# Altium schematic sheet Sheet4.SchDoc
size A3; SheetNumber: 4; SheetTotal: 6
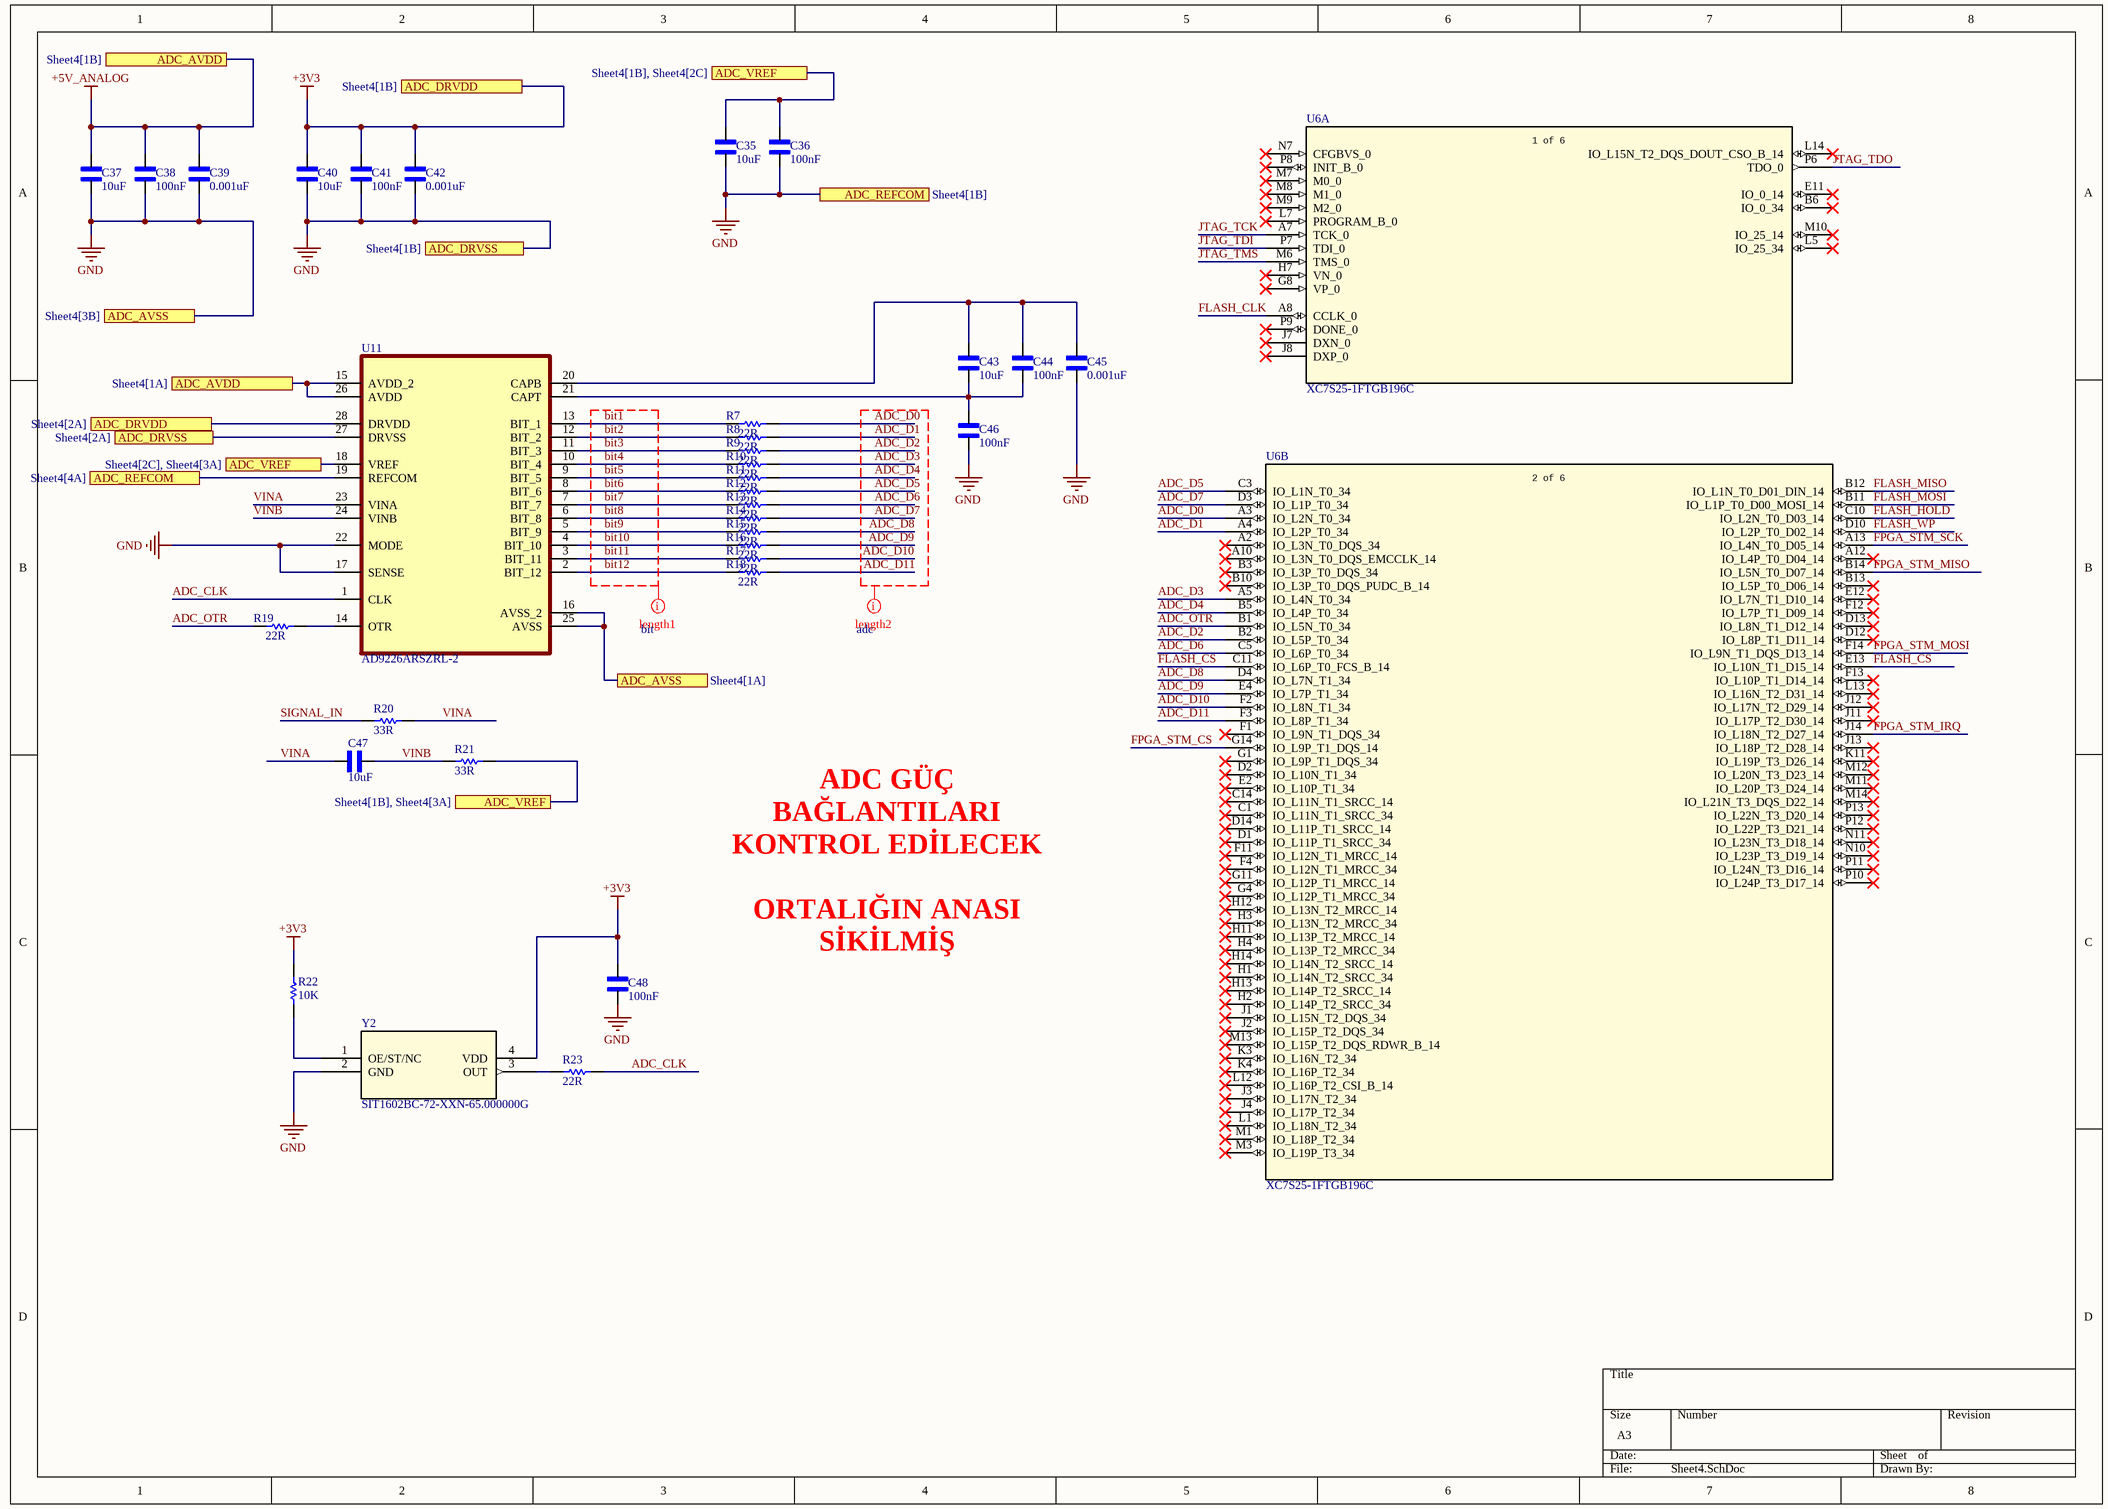
[diagram p0: Sheet4.SchDoc]

## Parts
C35  Parameter 1: 10uF  [0603]  (hidden comment: CAP_CER_0603)
C36  Parameter 1: 100nF  [0603]  (hidden comment: CAP_CER_0603)
C37  Parameter 1: 10uF  [0603]  (hidden comment: CAP_CER_0603)
C38  Parameter 1: 100nF  [0402]  (hidden comment: CC0402JRX7R7BB104)
C39  Parameter 1: 0.001uF  [0402]  (hidden comment: CC0402JRX7R7BB104)
C40  Parameter 1: 10uF  [0603]  (hidden comment: CAP_CER_0603)
C41  Parameter 1: 100nF  [0402]  (hidden comment: CC0402JRX7R7BB104)
C42  Parameter 1: 0.001uF  [0402]  (hidden comment: CC0402JRX7R7BB104)
C43  Parameter 1: 10uF  [0603]  (hidden comment: CAP_CER_0603)
C44  Parameter 1: 100nF  [0402]  (hidden comment: CC0402JRX7R7BB104)
C45  Parameter 1: 0.001uF  [0402]  (hidden comment: CC0402JRX7R7BB104)
C46  Parameter 1: 100nF  [0402]  (hidden comment: CC0402JRX7R7BB104)
C47  Parameter 1: 10uF  [0603]  (hidden comment: CAP_CER_0603)
C48  Parameter 1: 100nF  [0402]  (hidden comment: CC0402JRX7R7BB104)
R7  22R  [RESC1608X55X25LL10T15]
R8  22R  [RESC1608X55X25LL10T15]
R9  22R  [RESC1608X55X25LL10T15]
R10  22R  [RESC1608X55X25LL10T15]
R11  22R  [RESC1608X55X25LL10T15]
R12  22R  [RESC1608X55X25LL10T15]
R13  22R  [RESC1608X55X25LL10T15]
R14  22R  [RESC1608X55X25LL10T15]
R15  22R  [RESC1608X55X25LL10T15]
R16  22R  [RESC1608X55X25LL10T15]
R17  22R  [RESC1608X55X25LL10T15]
R18  22R  [RESC1608X55X25LL10T15]
R19  22R  [RESC1608X55X25LL10T15]
R20  33R  [RESC1608X55X25LL10T15]
R21  33R  [RESC1608X55X25LL10T15]
R22  10K  [RESC1608X55X25LL10T15]
R23  22R  [RESC1608X55X25LL10T15]
U6  XC7S25-1FTGB196C  [FTGB196SPARTAN-7_AMD]  (parts A,B of 6)
U11  AD9226ARSZRL-2  [SSOP-28]
Y2  SIT1602BC-72-XXN-65.000000G  [SON4_SIT1602-7_SIT]

## Ports
ADC_AVDD (see Sheet4[1A]), ADC_AVDD (see Sheet4[1B]), ADC_AVSS (see Sheet4[1A]), ADC_AVSS (see Sheet4[3B]), ADC_DRVDD (see Sheet4[1B]), ADC_DRVDD (see Sheet4[2A]), ADC_DRVSS (see Sheet4[1B]), ADC_DRVSS (see Sheet4[2A]), ADC_REFCOM (see Sheet4[1B]), ADC_REFCOM (see Sheet4[4A]), ADC_VREF (see Sheet4[1B], Sheet4[2C]), ADC_VREF (see Sheet4[1B], Sheet4[3A]), ADC_VREF (see Sheet4[2C], Sheet4[3A])

## Nets
+3V3: C40.2 C41.2 C42.2 C48.2 R22.1 U11.28(DRVDD) Y2.4(VDD) ; port ADC_DRVDD
+5V_ANALOG: C37.2 C38.2 C39.2 U11.15(AVDD_2) U11.26(AVDD) ; port ADC_AVDD
GND: C35.1 C36.1 C37.1 C38.1 C39.1 C40.1 C41.1 C42.1 C45.1 C46.1 C48.1 U11.16(AVSS_2) U11.17(SENSE) U11.19(REFCOM) U11.22(MODE) U11.25(AVSS) U11.27(DRVSS) Y2.2(GND) ; port ADC_REFCOM, port ADC_DRVSS, port ADC_AVSS
ADC_CLK: R23.1 U11.1(CLK)
ADC_D0: R7.1 U6.A3(IO_L2N_T0_34)
ADC_D1: R8.1 U6.A4(IO_L2P_T0_34)
ADC_D2: R9.1 U6.B2(IO_L5P_T0_34)
ADC_D3: R10.1 U6.A5(IO_L4N_T0_34)
ADC_D4: R11.1 U6.B5(IO_L4P_T0_34)
ADC_D5: R12.1 U6.C3(IO_L1N_T0_34)
ADC_D6: R13.1 U6.C5(IO_L6P_T0_34)
ADC_D7: R14.1 U6.D3(IO_L1P_T0_34)
ADC_D8: R15.1 U6.D4(IO_L7N_T1_34)
ADC_D9: R16.1 U6.E4(IO_L7P_T1_34)
ADC_D10: R17.1 U6.F2(IO_L8N_T1_34)
ADC_D11: R18.1 U6.F3(IO_L8P_T1_34)
ADC_OTR: R19.2 U6.B1(IO_L5N_T0_34)
ADC_VREF: C35.2 C36.2 R21.1 U11.18(VREF) ; port ADC_VREF
bit1: R7.2 U11.13(BIT_1)
bit2: R8.2 U11.12(BIT_2)
bit3: R9.2 U11.11(BIT_3)
bit4: R10.2 U11.10(BIT_4)
bit5: R11.2 U11.9(BIT_5)
bit6: R12.2 U11.8(BIT_6)
bit7: R13.2 U11.7(BIT_7)
bit8: R14.2 U11.6(BIT_8)
bit9: R15.2 U11.5(BIT_9)
bit10: R16.2 U11.4(BIT_10)
bit11: R17.2 U11.3(BIT_11)
bit12: R18.2 U11.2(BIT_12)
FLASH_CLK: U6.A8(CCLK_0)
FLASH_CS: U6.C11(IO_L6P_T0_FCS_B_14) U6.E13(IO_L10N_T1_D15_14)
FLASH_HOLD: U6.C10(IO_L2N_T0_D03_14)
FLASH_MISO: U6.B12(IO_L1N_T0_D01_DIN_14)
FLASH_MOSI: U6.B11(IO_L1P_T0_D00_MOSI_14)
FLASH_WP: U6.D10(IO_L2P_T0_D02_14)
FPGA_STM_CS: U6.G14(IO_L9P_T1_DQS_14)
FPGA_STM_IRQ: U6.J14(IO_L18N_T2_D27_14)
FPGA_STM_MISO: U6.B14(IO_L5N_T0_D07_14)
FPGA_STM_MOSI: U6.F14(IO_L9N_T1_DQS_D13_14)
FPGA_STM_SCK: U6.A13(IO_L4N_T0_D05_14)
JTAG_TCK: U6.A7(TCK_0)
JTAG_TDI: U6.P7(TDI_0)
JTAG_TDO: U6.P6(TDO_0)
JTAG_TMS: U6.M6(TMS_0)
SIGNAL_IN: R20.2
VINA: C47.2 R20.1 U11.23(VINA)
VINB: C47.1 R21.2 U11.24(VINB)
NetC43_1: C43.1 C44.1 C46.2 U11.21(CAPT)
NetC43_2: C43.2 C44.2 C45.2 U11.20(CAPB)
NetR19_1: R19.1 U11.14(OTR)
NetR22_2: R22.2 Y2.1(OE/ST/NC)
NetR23_2: R23.2 Y2.3(OUT)

Not connected (* = marked no-connect by the designer): U6 A2(IO_L3N_T0_DQS_34)* A10(IO_L3N_T0_DQS_EMCCLK_14)* A12(IO_L4P_T0_D04_14)* B3(IO_L3P_T0_DQS_34)* B6(IO_0_34)* B10(IO_L3P_T0_DQS_PUDC_B_14)* B13(IO_L5P_T0_D06_14)* C1(IO_L11N_T1_SRCC_34)* C14(IO_L11N_T1_SRCC_14)* D1(IO_L11P_T1_SRCC_34)* D2(IO_L10N_T1_34)* D12(IO_L8P_T1_D11_14)* D13(IO_L8N_T1_D12_14)* D14(IO_L11P_T1_SRCC_14)* E2(IO_L10P_T1_34)* E11(IO_0_14)* E12(IO_L7N_T1_D10_14)* F1(IO_L9N_T1_DQS_34)* F4(IO_L12N_T1_MRCC_34)* F11(IO_L12N_T1_MRCC_14)* F12(IO_L7P_T1_D09_14)* F13(IO_L10P_T1_D14_14)* G1(IO_L9P_T1_DQS_34)* G4(IO_L12P_T1_MRCC_34)* G8(VP_0)* G11(IO_L12P_T1_MRCC_14)* H1(IO_L14N_T2_SRCC_34)* H2(IO_L14P_T2_SRCC_34)* H3(IO_L13N_T2_MRCC_34)* H4(IO_L13P_T2_MRCC_34)* H7(VN_0)* H11(IO_L13P_T2_MRCC_14)* H12(IO_L13N_T2_MRCC_14)* H13(IO_L14P_T2_SRCC_14)* H14(IO_L14N_T2_SRCC_14)* J1(IO_L15N_T2_DQS_34)* J2(IO_L15P_T2_DQS_34)* J3(IO_L17N_T2_34)* J4(IO_L17P_T2_34)* J7(DXN_0)* J8(DXP_0)* J11(IO_L17P_T2_D30_14)* J12(IO_L17N_T2_D29_14)* J13(IO_L18P_T2_D28_14)* K3(IO_L16N_T2_34)* K4(IO_L16P_T2_34)* K11(IO_L19P_T3_D26_14)* L1(IO_L18N_T2_34)* L5(IO_25_34)* L7(PROGRAM_B_0)* L12(IO_L16P_T2_CSI_B_14)* L13(IO_L16N_T2_D31_14)* L14(IO_L15N_T2_DQS_DOUT_CSO_B_14)* M1(IO_L18P_T2_34)* M3(IO_L19P_T3_34)* M7(M0_0)* M8(M1_0)* M9(M2_0)* M10(IO_25_14)* M11(IO_L20P_T3_D24_14)* M12(IO_L20N_T3_D23_14)* M13(IO_L15P_T2_DQS_RDWR_B_14)* M14(IO_L21N_T3_DQS_D22_14)* N7(CFGBVS_0)* N10(IO_L23P_T3_D19_14)* N11(IO_L23N_T3_D18_14)* P8(INIT_B_0)* P9(DONE_0)* P10(IO_L24P_T3_D17_14)* P11(IO_L24N_T3_D16_14)* P12(IO_L22P_T3_D21_14)* P13(IO_L22N_T3_D20_14)*

## Layout directives
net class bit: bit1, bit2, bit3, bit4, bit5, bit6, bit7, bit8, bit9, bit10, bit11, bit12
net class adc: ADC_D0, ADC_D1, ADC_D2, ADC_D3, ADC_D4, ADC_D5, ADC_D6, ADC_D7, ADC_D8, ADC_D9, ADC_D10, ADC_D11

## Notes on the sheet
- ADC GÜÇ BAĞLANTILARI KONTROL EDİLECEK
  ORTALIĞIN ANASI SİKİLMİŞ
- (in symbol XC7S25-1FTGB196C_1, part A) 1 of 6
- (in symbol XC7S25-1FTGB196C_1, part B) 2 of 6

## Library data of the parts
C38 C39 C41 C42 C44-C46 C48 = CAP_CER_0402: CAP CER 0.1UF 16V X7R 0402
R7-R23 = CMP-2000-06928-1: Chip Resistor, 147 KOhm, +/- 1%, 0.1 W, -55 to 155 degC, 0603 (1608 Metric), RoHS, Tape and Reel; Manufacturer: Yageo; Temperature Coefficient: ±100ppm/°C; Power (Watts): 0.1W,1/10W; PCN Other: RC/AC0603/0805/120622/Jan/2013; Kits: PHH6-KIT-ND-RESKIT100K-1M1/10W5750PCS; EDA / CAD Models: DownloadfromAcceleratedDesigns; Online Catalog: RC0603Series; HTML Datasheet: RCSeries,LSuffixDatasheet.html; Resistance (Ohms): 147k; Catalog Drawings: ThickFilmResistorSide; Other Names: 311-147KHRCT; Product Training Modules: ChipResistor; Series: RC; Height: 0.022"(0.55mm); Number of Terminations: 2; Family: ChipResistor-SurfaceMount; Manufacturer URL: http://www.yageo.com/; Tolerance: ±1%; Operating Temperature: -55°C~155°C; Datasheet Version: Rev. 7, 05/2017; Standard Package: 1; Category: Resistors; Packaging: CutTape(CT); Size / Dimension: 0.063"Lx0.031"W(1.60mmx0.80mm); Datasheet URL: http://www.yageo.com/documents/recent/PYu-RC_Group_51_RoHS_L_7.pdf; Package / Case: 0603(1608Metric); Package Reference: 0603; Supplier Device Package: 0603; Composition: ThickFilm; Features: MoistureResistant; Mounting Technology: SurfaceMount; Package Description: 2-Pin Surface Mount Device, Body 1.6 x 0.8 mm
U6 = XC7S25-1FTGB196C_1: Description; Manufacturer_Name: AMD; Type: Embedded; Copyright: Copyright (C) 2025 Ultra Librarian. All rights reserved.; Manufacturer_Part_Number: XC7S25-1FTGB196C; RefDes: RefDes; Supplier: Arrow Electronics; Supplier Part Number: AD9226ARSZ
U11 = AD9226ARSZRL-2: 12-Bit, 65 MSPS Analog-to-Digital Converter
Y2 = SIT1602BC-72-XXN-65.000000G: Oscillator MEMS 65MHz ±25ppm (Stability) 15pF HCMOS/LVCMOS 55% 2.5V/3.3V 4-Pin QFN SMD T/R; Manufacturer: SiTime; Fall Time: 2ns; Max Supply Voltage: 3.63V; Min Supply Voltage: 2.25V; Output Type: LVCMOS; Supplier: Avnet; Supplier Part Number: SIT1602BC-72-XXN-65.000000G; Manufacturer Part Number: SIT1602BC-72-XXN-65.000000G; RoHS: Compliant; Category: Crystals; Pricing: 250=0,94997, 500=0,93011, 1000=0,91025, 2000=0,89039, 4000=0,87053 (USD); Country of Origin: Malaysia, Taiwan, Thailand; Frequency: 65MHz; Frequency Stability: 25ppm; Introduction Date: 2017-05-31; Lifecycle Status: Production; Load Capacitance: 15pF; Max Operating Temperature: 70°C; Min Operating Temperature: -20°C; Mounting Technology: Surface Mount; Number of Terminals: 4; REACH SVHC: Yes; Rise Time: 2ns; ComponentLink1URL: https://datasheet.octopart.com:443/SIT1602BC-72-XXN-65.000000G-SiTime-datasheet-168041894.pdf?src-supplier=IHS; ComponentLink1Description: https://datasheet.octopart.com:443/SIT1602BC-72-XXN-65.000000G-SiTime-datasheet-168041894.pdf?src-supplier=IHS; ComponentLink2URL: https://datasheet.octopart.com:443/SIT1602BC-72-XXN-65.000000G-SiTime-datasheet-180805158.pdf?src-supplier=IHS; ComponentLink2Description: https://datasheet.octopart.com:443/SIT1602BC-72-XXN-65.000000G-SiTime-datasheet-180805158.pdf?src-supplier=IHS